# Altium schematic sheet Connector_Sheet.SchDoc
size A4; SheetNumber: 4; SheetTotal: 6
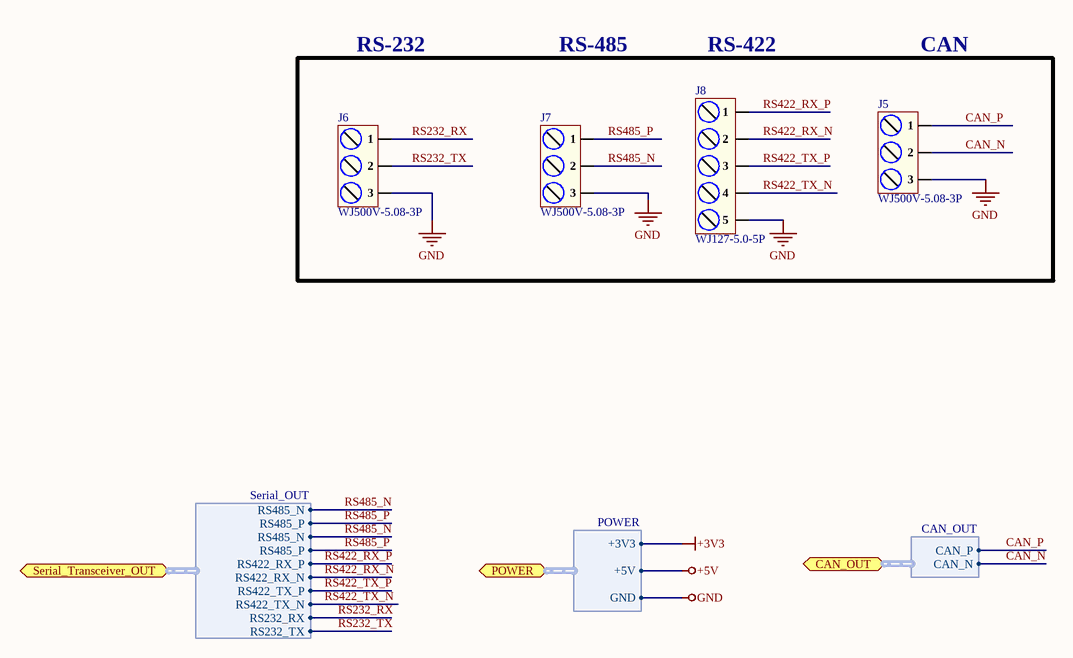
[diagram p0: Connector_Sheet.SchDoc]

## Parts
J5  WJ500V-5.08-3P  [WJ500V-5.08-3P]
J6  WJ500V-5.08-3P  [WJ500V-5.08-3P]
J7  WJ500V-5.08-3P  [WJ500V-5.08-3P]
J8  WJ127-5.0-5P  [WJ127-5.0-5P]

## Ports
CAN_OUT (bidir, harness CAN_OUT), POWER (bidir, harness POWER), Serial_Transceiver_OUT (bidir, harness Serial_OUT)

## Harnesses
CAN_OUT: CAN_P, CAN_N
POWER: +3V3, +5V, GND
Serial_OUT: RS485_N, RS485_P, RS485_N, RS485_P, RS422_RX_P, RS422_RX_N, RS422_TX_P, RS422_TX_N, RS232_RX, RS232_TX

## Nets
+3V3: port POWER.+3V3
+5V: port POWER.+5V
GND: J5.3 J6.3 J7.3 J8.5 ; port POWER.GND
CAN_N: J5.2 ; port CAN_OUT.CAN_N
CAN_P: J5.1 ; port CAN_OUT.CAN_P
RS232_RX: J6.1 ; port Serial_Transceiver_OUT.RS232_RX
RS232_TX: J6.2 ; port Serial_Transceiver_OUT.RS232_TX
RS422_RX_N: J8.2 ; port Serial_Transceiver_OUT.RS422_RX_N
RS422_RX_P: J8.1 ; port Serial_Transceiver_OUT.RS422_RX_P
RS422_TX_N: J8.4 ; port Serial_Transceiver_OUT.RS422_TX_N
RS422_TX_P: J8.3 ; port Serial_Transceiver_OUT.RS422_TX_P
RS485_N: J7.2 ; port Serial_Transceiver_OUT.RS485_N
RS485_P: J7.1 ; port Serial_Transceiver_OUT.RS485_P

## Notes on the sheet
- RS-232
- RS-485
- RS-422
- CAN
- File:
- Title:
- Date:
- Page
- Num:
- Total:
- Drawn By: Huzaifa Ali

## Library data of the parts
J5-J7 = WJ500V-5.08-3P: 1x3P 18A -40℃~+105℃ 250V Green 14~30 Straight pin 5.08mm 2.5 1 3 Plugin,P=5.08mm Screw terminal ROHS; Manufacturer: Ningbo Kangnex Elec; Item Type: Terminal Block; Manufacturer Part Number: WJ500V-5.08-3P; Package: Plugin,P=5.08mm; LCSC Part Number: C72334; ComponentLink1Description: LCSC; ComponentLink1URL: https://www.lcsc.com/product-detail/Screw-terminal_Ningbo-Kangnex-Elec-WJ500V-5-08-3P_C72334.html
J8 = WJ127-5.0-5P: 1x5P -40℃~+105℃ 15A 250V Green 14~26 Straight pin 5mm 1.5 1 5 Plugin,P=5mm Screw terminal ROHS; Manufacturer: Ningbo Kangnex Elec; ComponentLink1Description: LCSC; ComponentLink1URL: https://www.lcsc.com/product-detail/Screw-terminal_Ningbo-Kangnex-Elec-WJ127-5-0-5P_C192780.html; Manufacturer Part Number: WJ127-5.0-5P; Package: Plugin,P=5mm; LCSC Part Number: C192780; Item Type: Screw terminal